# Altium schematic sheet 05 Ethernet.SchDoc
size A3; Revision: V1.2; SheetNumber: 5; SheetTotal: 11
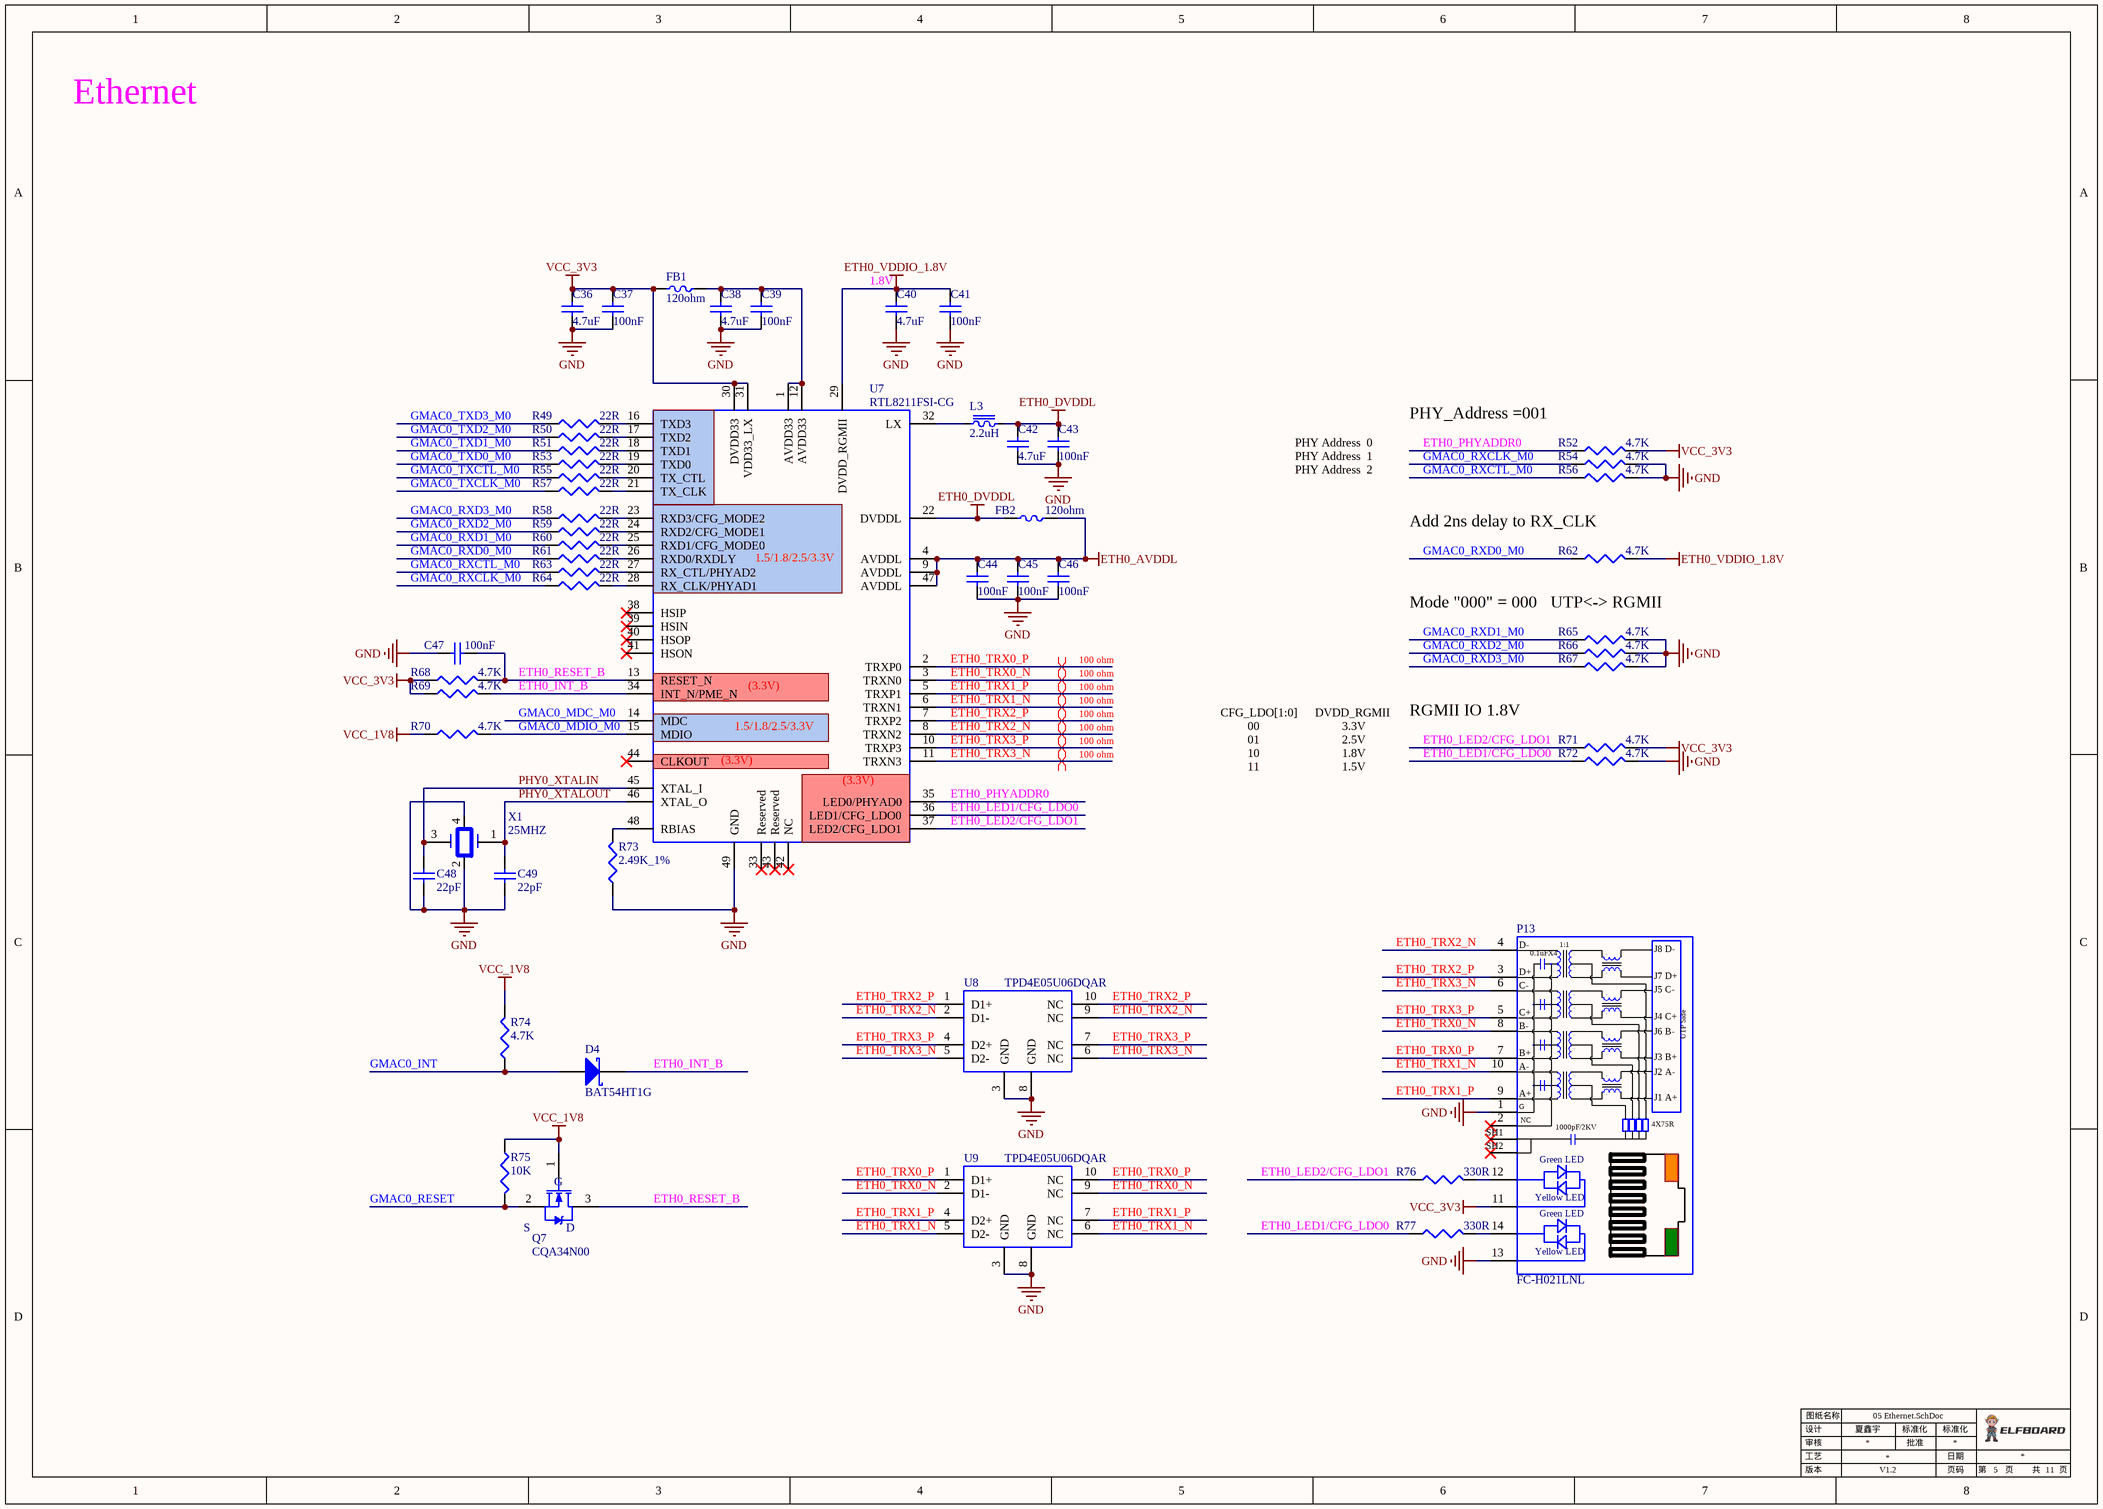
[diagram p0: 05 Ethernet.SchDoc]

## Parts
C36  4.7uF  [0402C]
C37  100nF  [0402C]
C38  4.7uF  [0402C]
C39  100nF  [0402C]
C40  4.7uF  [0402C]
C41  100nF  [0402C]
C42  4.7uF  [0402C]
C43  100nF  [0402C]
C44  100nF  [0402C]
C45  100nF  [0402C]
C46  100nF  [0402C]
C47  100nF  [0402C]
C48  22pF  [0402C]
C49  22pF  [0402C]
D4  BAT54HT1G  [SOD_323]
FB1  120ohm  [0603L]
FB2  120ohm  [0603L]
L3  2.2uH  [L_2.1*1.6]
P13  FC-H021LNL  [RJ45_Gigabit]
Q7  CQA34N00  [SOT_233_W]
R49  22R  [0402R]
R50  22R  [0402R]
R51  22R  [0402R]
R52  4.7K  [0402R]
R53  22R  [0402R]
R54  4.7K  [0402R]
R55  22R  [0402R]
R56  4.7K  [0402R]
R57  22R  [0402R]
R58  22R  [0402R]
R59  22R  [0402R]
R60  22R  [0402R]
R61  22R  [0402R]
R62  4.7K  [0402R]
R63  22R  [0402R]
R64  22R  [0402R]
R65  4.7K  [0402R]
R66  4.7K  [0402R]
R67  4.7K  [0402R]
R68  4.7K  [0402R]
R69  4.7K  [0402R]
R70  4.7K  [0402R]
R71  4.7K  [0402R]
R72  4.7K  [0402R]
R73  2.49K_1%  [0402R]
R74  4.7K  [0402R]
R75  10K  [0402R]
R76  330R  [0402R]
R77  330R  [0402R]
U7  RTL8211FSI-CG  [QFN48-0_4-6X6-PH1_0]
U8  TPD4E05U06DQAR  [USON-10]
U9  TPD4E05U06DQAR  [USON-10]
X1  25MHZ  [Crystals_3225]

## Nets
ETH0_AVDDL: C44.2 C45.2 C46.2 FB2.2 U7.4(AVDDL) U7.9(AVDDL) U7.47(AVDDL)
ETH0_DVDDL: C42.2 C43.2 FB2.1 L3.2 U7.22(DVDDL)
ETH0_VDDIO_1.8V: C40.2 C41.2 R62.2 U7.29(DVDD_RGMII)
GND: C36.1 C37.1 C38.1 C39.1 C40.1 C41.1 C42.1 C43.1 C44.1 C45.1 C46.1 C47.1 C48.1 C49.1 P13.1(GND) P13.13 R54.2 R56.2 R65.2 R66.2 R67.2 R72.2 R73.1 U7.49(GND) U8.3(GND) U8.8(GND) U9.3(GND) U9.8(GND) X1.2 X1.4
VCC_1V8: Q7.1(G) R70.1 R74.2 R75.1
VCC_3V3: C36.2 C37.2 FB1.1 P13.11 R52.2 R68.1 R69.1 R71.2 U7.30(DVDD33) U7.31(VDD33_LX)
ETH0_INT_B: D4.2(K) R69.2 U7.34(INT_N/PME_N)
ETH0_LED1/CFG_LDO0: R72.1 R77.1 U7.36(LED1/CFG_LDO0)
ETH0_LED2/CFG_LDO1: R71.1 R76.1 U7.37(LED2/CFG_LDO1)
ETH0_PHYADDR0: R52.1 U7.35(LED0/PHYAD0)
ETH0_RESET_B: C47.2 Q7.3(D) R68.2 U7.13(RESET_N)
ETH0_TRX0_N: P13.8(B-) U7.3(TRXN0) U9.2(D1-) U9.9(NC)
ETH0_TRX0_P: P13.7(B+) U7.2(TRXP0) U9.1(D1+) U9.10(NC)
ETH0_TRX1_N: P13.10(A-) U7.6(TRXN1) U9.5(D2-) U9.6(NC)
ETH0_TRX1_P: P13.9(A+) U7.5(TRXP1) U9.4(D2+) U9.7(NC)
ETH0_TRX2_N: P13.4(D-) U7.8(TRXN2) U8.2(D1-) U8.9(NC)
ETH0_TRX2_P: P13.3(D+) U7.7(TRXP2) U8.1(D1+) U8.10(NC)
ETH0_TRX3_N: P13.6(C-) U7.11(TRXN3) U8.5(D2-) U8.6(NC)
ETH0_TRX3_P: P13.5(C+) U7.10(TRXP3) U8.4(D2+) U8.7(NC)
GMAC0_INT: D4.1(A) R74.1
GMAC0_MDC_M0: U7.14(MDC)
GMAC0_MDIO_M0: R70.2 U7.15(MDIO)
GMAC0_RESET: Q7.2(S) R75.2
GMAC0_RXCLK_M0: R54.1 R64.1
GMAC0_RXCTL_M0: R56.1 R63.1
GMAC0_RXD0_M0: R61.1 R62.1
GMAC0_RXD1_M0: R60.1 R65.1
GMAC0_RXD2_M0: R59.1 R66.1
GMAC0_RXD3_M0: R58.1 R67.1
GMAC0_TXCLK_M0: R57.1
GMAC0_TXCTL_M0: R55.1
GMAC0_TXD0_M0: R53.1
GMAC0_TXD1_M0: R51.1
GMAC0_TXD2_M0: R50.1
GMAC0_TXD3_M0: R49.1
PHY0_XTALIN: C48.2 U7.45(XTAL_I) X1.3
PHY0_XTALOUT: C49.2 U7.46(XTAL_O) X1.1
NetC38_2: C38.2 C39.2 FB1.2 U7.1(AVDD33) U7.12(AVDD33)
NetL3_1: L3.1 U7.32(LX)
NetP13_12: P13.12 R76.2
NetP13_14: P13.14 R77.2
NetR49_2: R49.2 U7.16(TXD3)
NetR50_2: R50.2 U7.17(TXD2)
NetR51_2: R51.2 U7.18(TXD1)
NetR53_2: R53.2 U7.19(TXD0)
NetR55_2: R55.2 U7.20(TX_CTL)
NetR57_2: R57.2 U7.21(TX_CLK)
NetR58_2: R58.2 U7.23(RXD3/CFG_MODE2)
NetR59_2: R59.2 U7.24(RXD2/CFG_MODE1)
NetR60_2: R60.2 U7.25(RXD1/CFG_MODE0)
NetR61_2: R61.2 U7.26(RXD0/RXDLY)
NetR63_2: R63.2 U7.27(RX_CTL/PHYAD2)
NetR64_2: R64.2 U7.28(RX_CLK/PHYAD1)
NetR73_2: R73.2 U7.48(RBIAS)

Not connected (* = marked no-connect by the designer): P13 2(NC)* SH1* SH2*; U7 33(Reserved)* 38(HSIP)* 39(HSIN)* 40(HSOP)* 41(HSON)* 42(NC)* 43(Reserved)* 44(CLKOUT)*

## Layout directives
differential pair; differential pair class 100 ohm: ETH0_TRX0_N, ETH0_TRX0_P, ETH0_TRX1_N, ETH0_TRX1_P, ETH0_TRX2_N, ETH0_TRX2_P, ETH0_TRX3_N, ETH0_TRX3_P

## Notes on the sheet
- Ethernet
- (near C40) 1.8V
- PHY Address  0
- PHY_Address =001
- PHY Address  1
- PHY Address  2
- Add 2ns delay to RX_CLK
- Mode "000" = 000   UTP<-> RGMII
- CFG_LDO[1:0]
- DVDD_RGMII
- RGMII IO 1.8V
- 00
- 01
- 10
- 11
- 3.3V
- 2.5V
- 1.8V
- 1.5V
- 设计
- 审核
- 工艺
- 图纸名称
- 夏鑫宇
- 批准
- 标准化
- 日期
- 版本
- 页码
- 第
- 页
- 共
- (in symbol 1110405363) 1.5/1.8/2.5/3.3V; (3.3V)
- (in symbol 1120202201) 1:1; 0.1uFX4; J8 D-; J7 D+; J5 C-; J4 C+; J6 B-; UTP Side; J3 B+; J2 A-; J1 A+; G; 1000pF/2KV; 4X75R; Green LED; Yellow LED

## Library data of the parts
C36 C38 C40 C42 = 1110202032: 序号: 616; 存货名称: 贴装叠层陶瓷电容; 规格型号: 0402,4.7uF,10V,±10％,X5R; Published: 8-Jun-2000; LatestRevisionDate: 17-Jul-2002; LatestRevisionNote: Re-released for DXP Platform.; PackageReference: RAD-0.3; Publisher: Altium Limited; PackageDescription: Radial Cap, Thru-Hole; 2 Leads; 0.3 in Pin Spacing; Value: 4.7uF; 存货编码: 1110202032
C37 C39 C41 C43-C47 = 1110202039: 序号: 626; 存货名称: 贴装叠层陶瓷电容; 规格型号: 0402,100nF,25V,±10％,X5R; Published: 8-Jun-2000; LatestRevisionDate: 17-Jul-2002; LatestRevisionNote: Re-released for DXP Platform.; PackageReference: RAD-0.3; Publisher: Altium Limited; PackageDescription: Radial Cap, Thru-Hole; 2 Leads; 0.3 in Pin Spacing; Value: 100nF; 存货编码: 1110202039
C48 C49 = 1110202003: 序号: 572; 存货名称: 贴装叠层陶瓷电容; 规格型号: 0402,22pF,50V,±5％,NPO; 禁用状态: 否; Published: 8-Jun-2000; LatestRevisionDate: 17-Jul-2002; LatestRevisionNote: Re-released for DXP Platform.; PackageReference: RAD-0.3; Publisher: Altium Limited; PackageDescription: Radial Cap, Thru-Hole; 2 Leads; 0.3 in Pin Spacing; Value: 22pF; 存货编码: 1110202003
D4 = 1110501028: 序号: 2525; 存货名称: 肖特基二极管; 规格型号: BAT54HT1G,SOD323; Published: 8-Jun-2000; LatestRevisionDate: 17-Jul-2002; LatestRevisionNote: Re-released for DXP Platform.; PackageReference: SMB; Publisher: Altium Limited; PackageDescription: DO-214-AA/SMB; 2 C-Bend Leads; Body 5.3 x 3.6 mm, inc. leads (LxW); Code_JEDEC: DO-214-AA; 存货编码: 1110501028; Value: BAT54HT1G
FB1 = 1110304011: 序号: 1028; 存货名称: 磁珠; 规格型号: 0603,120ohm,500mA,WLCB1608-120Ω; VALUE: 120ohm; 存货编码: 1110304011
FB2 = 1110304011: 序号: 1028; 存货名称: 磁珠; 规格型号: 0603，120ohm; 主计量单位名称: 只; 安全库存: 12837.00; 旧编码: 010301092; VALUE: 120ohm; 存货编码: 1110304011; 启用日期: 2015/3/11
L3 = 1110301085: 序号: 948; 存货名称: 绕线电感; 规格型号: 2.2uH,2*1.6*1mm,2.15A,平行焊盘,非屏蔽,WPN201610H2R2MT; 禁用状态: 否; Published: 24-Mar-1999; LatestRevisionDate: 17-Jul-2002; LatestRevisionNote: Re-released for DXP Platform.; PackageReference: AXIAL-0.9; Publisher: Altium Limited; PackageDescription: Axial Device, Thru-Hole; 2 Leads; 0.9 in Pin Spacing; Value: 2.2uH; 存货编码: 1110301085
P13 = 1120202201: 存货名称: 插装网口座; 规格型号: HR851178A,RJ45,1000M,带灯,带变压器,无外围弹片,汉仁; 描述: 改外观替代1120202071; 禁用: 否; VALUE: FC-H021LNL; 存货编码: 1120202201
Q7 = 1110505035: Note: Pin 2 is electrically connected to pin 4.; 序号: 5012; 存货名称: 场效应管; 规格型号: CQA34N00,SOT23,N沟道; 描述: 替代1110505027; 禁用状态: 否; Published: 8-Jun-2000; LatestRevisionDate: 17-Jul-2002; LatestRevisionNote: Re-released for DXP Platform.; DatasheetVersion: PD-9.814; PackageVersion: Feb-1997; PackageReference: TO-220AB; Publisher: Altium Limited; PackageDescription: TO, Thru-Hole, Vertical, Heatsink Mounted; 3 In-Line Leads; Pitch 2.54 mm; VALUE: CQA34N00; 存货编码: 1110505035
R49-R51 R53 R55 R57-R61 R63 R64 = 1110102028: 序号: 41; 存货名称: 贴装电阻; 规格型号: 0402,22Ω,±5％; Value: 22R; 存货编码: 1110102028
R52 R54 R56 R62 R65-R72 R74 = 1110102003: 序号: 12; 存货名称: 贴装电阻; 规格型号: 0402,4.7K,±5％; Value: 4.7K; 存货编码: 1110102003
R73 = 1110102182: 存货名称: 贴装电阻; 规格型号: 0402,2.49K,±1％; 描述栏信息: 厚声; Value: 2.49K_1%; 存货编码: 1110102182
R75 = 1110102007: 序号: 17; 存货名称: 贴装电阻; 规格型号: 0402,10K,±5％; Value: 10K; 存货编码: 1110102007
R76 R77 = 1110102043: 序号: 56; 存货名称: 贴装电阻; 规格型号: 0402,330Ω,±5％; Value: 330R; 存货编码: 1110102043
U7 = 1110405363: 序号: 4251; 存货名称: 常规IC; 规格型号: RTL8211FSI-CG,QFN48; 描述: 替代1110405358; 禁用状态: 否; Value: RTL8211FSI-CG; 存货编码: 1110405363
U8 U9 = 1110503037: 存货名称: TVS管; 规格型号: TPD4E05U06DQAR,USON; Value: TPD4E05U06DQAR; 存货编码: 1110503037
X1 = 1110601037: 序号: 3392; 存货名称: 贴装晶振; 规格型号: 无源,25MHZ,4P,3.2*2.5mm,±20ppm,20pf; Value: 25MHZ; 存货编码: 1110601037